# Altium schematic sheet light_sensor.SchDoc
size 297 x 209 mm
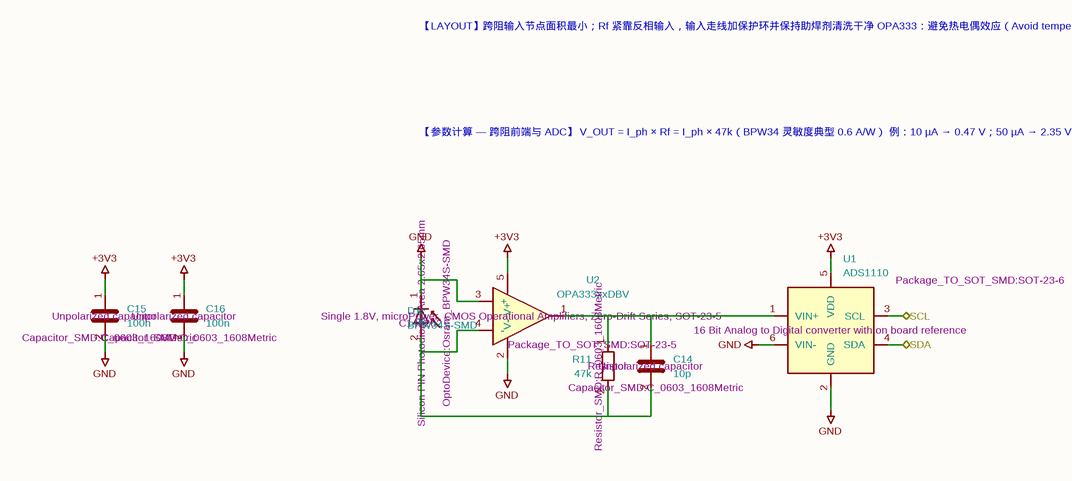
[diagram p0: light_sensor.SchDoc]

## Parts
C14  Description: Unpolarized capacitor  Footprint: Capacitor_SMD:C_0603_1608Metric  [C_0603_1608Metric]  (hidden comment: 10p)
C15  Description: Unpolarized capacitor  Footprint: Capacitor_SMD:C_0603_1608Metric  [C_0603_1608Metric]  (hidden comment: 100n)
C16  Description: Unpolarized capacitor  Footprint: Capacitor_SMD:C_0603_1608Metric  [C_0603_1608Metric]  (hidden comment: 100n)
D1  Description: Silicon PIN Photodiode, Area 2.65x2.65mm  LCSC Part: C145262  Footprint: OptoDevice:Osram_BPW34S-SMD  [Osram_BPW34S-SMD]  (hidden comment: BPW34S-SMD)
R11  Description: Resistor  Footprint: Resistor_SMD:R_0603_1608Metric  [R_0603_1608Metric]  (hidden comment: 47k)
U1  Description: 16 Bit Analog to Digital converter with on board reference  Footprint: Package_TO_SOT_SMD:SOT-23-6  [SOT-23-6]  (hidden comment: ADS1110)
U2  Description: Single 1.8V, microPower, CMOS Operational Amplifiers, Zero-Drift Series, SOT-23-5  Footprint: Package_TO_SOT_SMD:SOT-23-5  [SOT-23-5]  (hidden comment: OPA333xxDBV)

## Ports
SCL (bidir), SDA (bidir)

## Nets
+3V3: C15.1 C16.1 U1.5(VDD) U2.5(V+)
GND: C15.2 C16.2 D1.1(K) U1.2(GND) U1.6(VIN-) U2.2(V-) U2.3(+)
SCL: U1.3(SCL) ; port SCL
SDA: U1.4(SDA) ; port SDA
NetC14_1: C14.1 R11.1 U1.1(VIN+) U2.1
NetC14_2: C14.2 D1.2(A) R11.2 U2.4(-)

## Notes on the sheet
- 【LAYOUT】跨阻输入节点面积最小；Rf 紧靠反相输入，输入走线加保护环并保持助焊剂清洗干净
  OPA333：避免热电偶效应（Avoid temperature gradients that create thermoelectric (Seebeck) effects）
  ——远离热源、避免异种金属结点、防止气流直吹
  ADS1110：差分输入成对走线、远离 SW 节点与电感；VDD 的 100nF 就近回地
- 【参数计算 — 跨阻前端与 ADC】
  V_OUT = I_ph × Rf = I_ph × 47k（BPW34 灵敏度典型 0.6 A/W）
  例：10 µA → 0.47 V；50 µA → 2.35 V（ADS1110 满量程 ±2.048 V @PGA=1）
  带宽 f_p = 1/(2π·Rf·Cf) = 1/(2π×47k×10p) = 339 kHz（Cf 兼作相位补偿）
  噪声：√(4kTRf) = 28 nV/√Hz，折合总噪声 ≈ 20 µV rms（约 0.3 LSB）
  ADC 分辨率：LSB = 4.096/65536 = 62.5 µV ⇒ 电流分辨率 62.5µ/47k = 1.33 nA
- 1
- 2
- 3
- 4
- 5
- 6
- A
- B
- C
- 光电：BPW34（光伏模式）+ OPA333 跨阻
- ADC：ADS1110 16 位差分，内部 2.048V 基准
- 增益：Rf = 47k，Cf = 10p
- D
- Title: 光强检测 — BPW34 跨阻 + ADS1110
- File: light_sensor.kicad_sch
- Sheet: /
- integrating_box_light_source
- KiCad E.D.A.  kicad (5.1.4)-1
- Size: A4
- Date: 2026-11-08
- Rev: A
- Id: 1/1

## Library data of the parts
C14-C16 = C
  C14: Value: 10p
  C15 C16: Value: 100n
D1 = BPW34-SMD: Value: BPW34S-SMD
R11 = R: Value: 47k
U1 = ADS1110: Value: ADS1110
U2 = OPA333xxDBV: Value: OPA333xxDBV